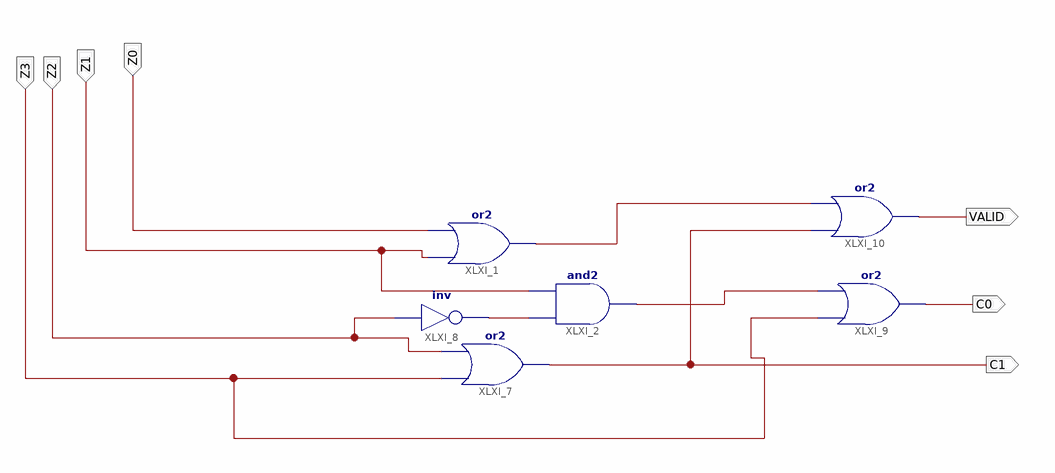
[diagram p0: schematic sheet 1]
// Xilinx ISE schematic firepanel.sch (spartan6) as structural Verilog: 6 symbols, 7 ports
module firepanel (
  input  Z0,
  input  Z1,
  input  Z2,
  input  Z3,
  output C1,
  output C0,
  output VALID
);

  wire XLXN_16, XLXN_20, XLXN_23;

  or XLXI_1 (XLXN_23, Z1, Z0);
  and XLXI_2 (XLXN_20, XLXN_16, Z1);
  or XLXI_7 (C1, Z3, Z2);
  not XLXI_8 (XLXN_16, Z2);
  or XLXI_9 (C0, Z3, XLXN_20);
  or XLXI_10 (VALID, C1, XLXN_23);
endmodule
